# Altium schematic sheet MiniSub_Power_Board.SchDoc
size A
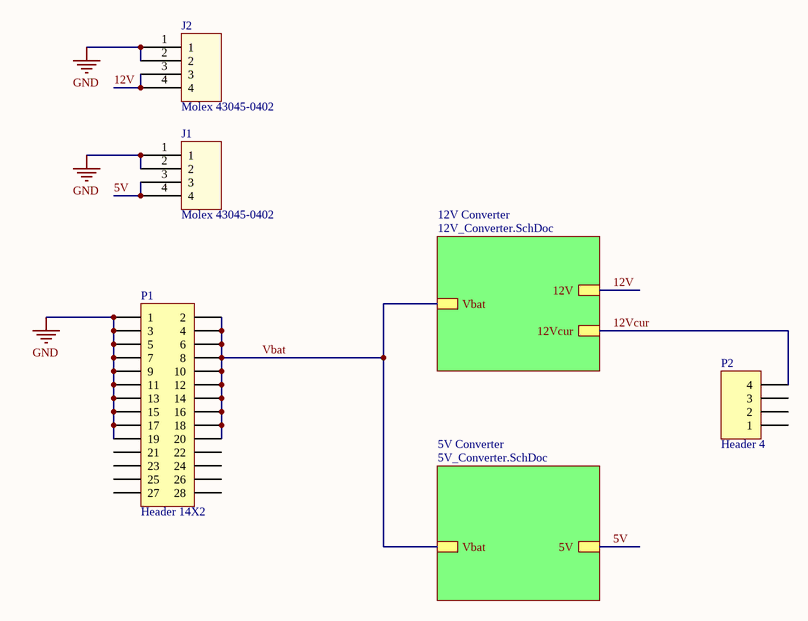
[diagram p0: MiniSub_Power_Board.SchDoc]

## Parts
J1  Molex 43045-0402  [Molex43045-0402]
J2  Molex 43045-0402  [Molex43045-0402]
P1  Header 14X2  [Header 2x14]
P2  Header 4  [Header 1x4]

## Sub-sheets
5V Converter = 5V_Converter.SchDoc: Vbat, 5V
12V Converter = 12V_Converter.SchDoc: Vbat, 12V, 12Vcur

## Nets
GND: J1.1 J1.2 J2.1 J2.2 P1.1 P1.3 P1.5 P1.7 P1.9 P1.11 P1.13 P1.15 P1.17 P1.19
5V: J1.3 J1.4 ; sheet 5V Converter/5V
12V: J2.3 J2.4 ; sheet 12V Converter/12V
12Vcur: P2.4 ; sheet 12V Converter/12Vcur
Vbat: P1.2 P1.4 P1.6 P1.8 P1.10 P1.12 P1.14 P1.16 P1.18 P1.20 ; sheet 12V Converter/Vbat, sheet 5V Converter/Vbat

Not connected (* = marked no-connect by the designer): P1 21 22 23 24 25 26 27 28; P2 1 2 3

## Library data of the parts
J1 J2 = Molex43045-0402: Micro-Fit 3.0 Right Angle Header, 3.00mm Pitch, Dual Row, 4 Circuits, with Snap-in Plastic Peg PCB Lock, Gold, Glow Wire Capable, Black; ComponentLink1Description: Molex Website; ComponentLink1URL: https://www.molex.com/molex/products/datasheet.jsp?part=active/0430450402_PCB_HEADERS.xml
P1 = Header 14X2: Header, 14-Pin, Dual row; LatestRevisionDate: 17-Jul-2002; LatestRevisionNote: Re-released for DXP Platform.; Publisher: Altium Limited
P2 = Header 4: Header, 4-Pin; LatestRevisionDate: 17-Jul-2002; LatestRevisionNote: Re-released for DXP Platform.; Publisher: Altium Limited